# EasyEDA Pro project ProPrj_NavBot-EN01_2026-09-24.epro, board MAIN
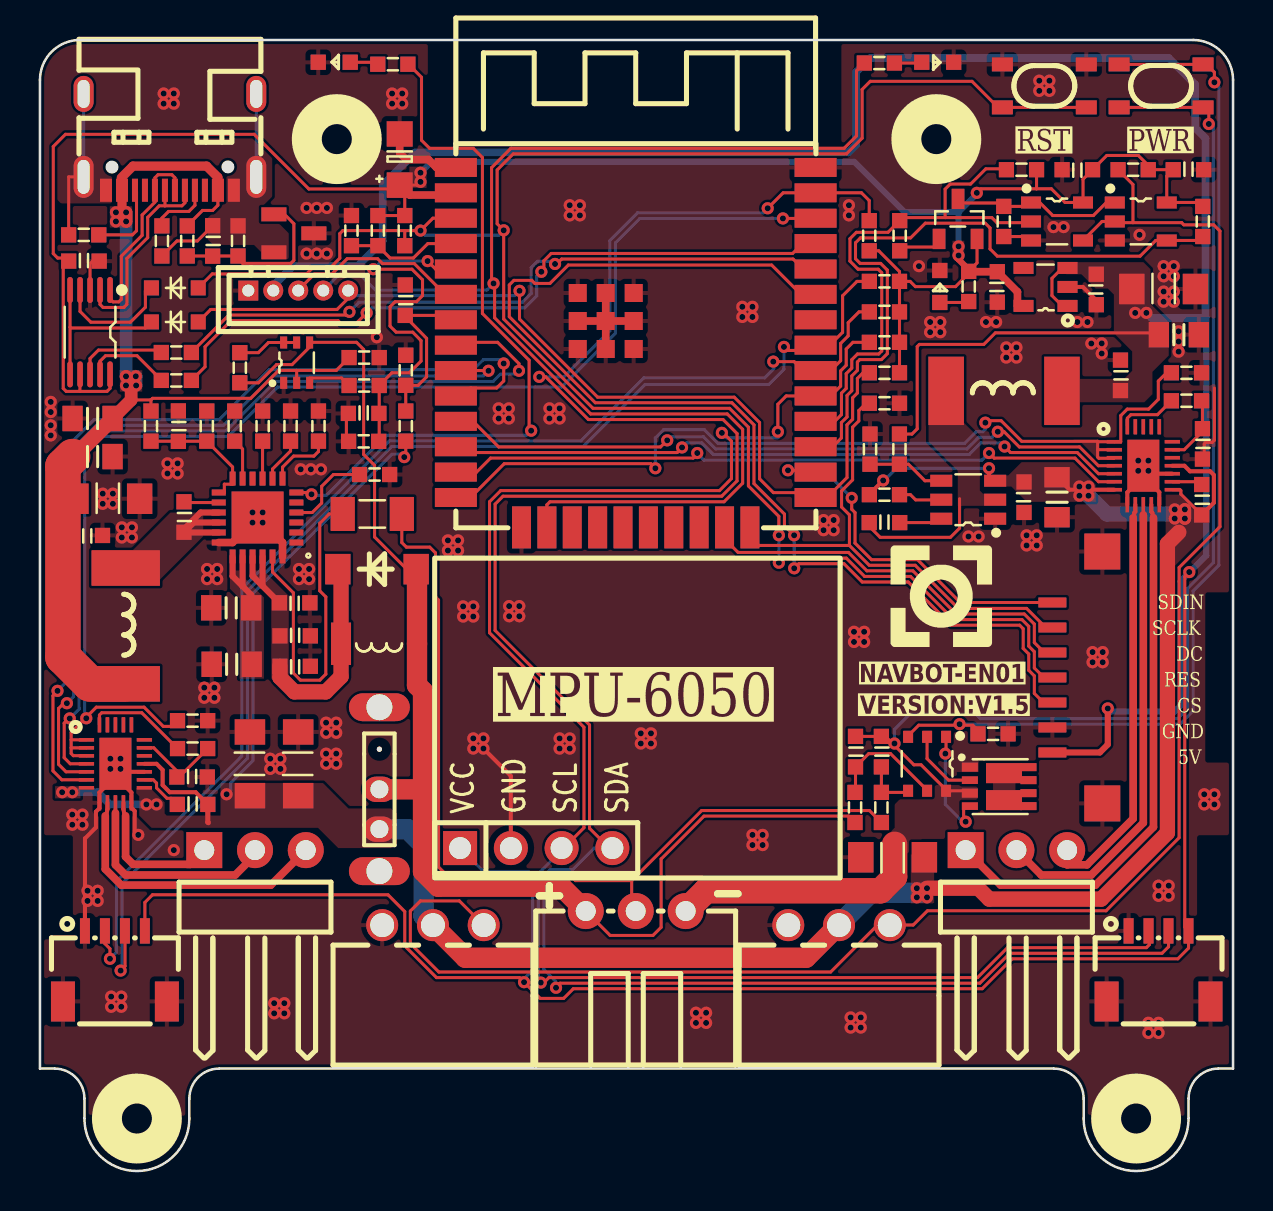
[diagram p9: board, top side]
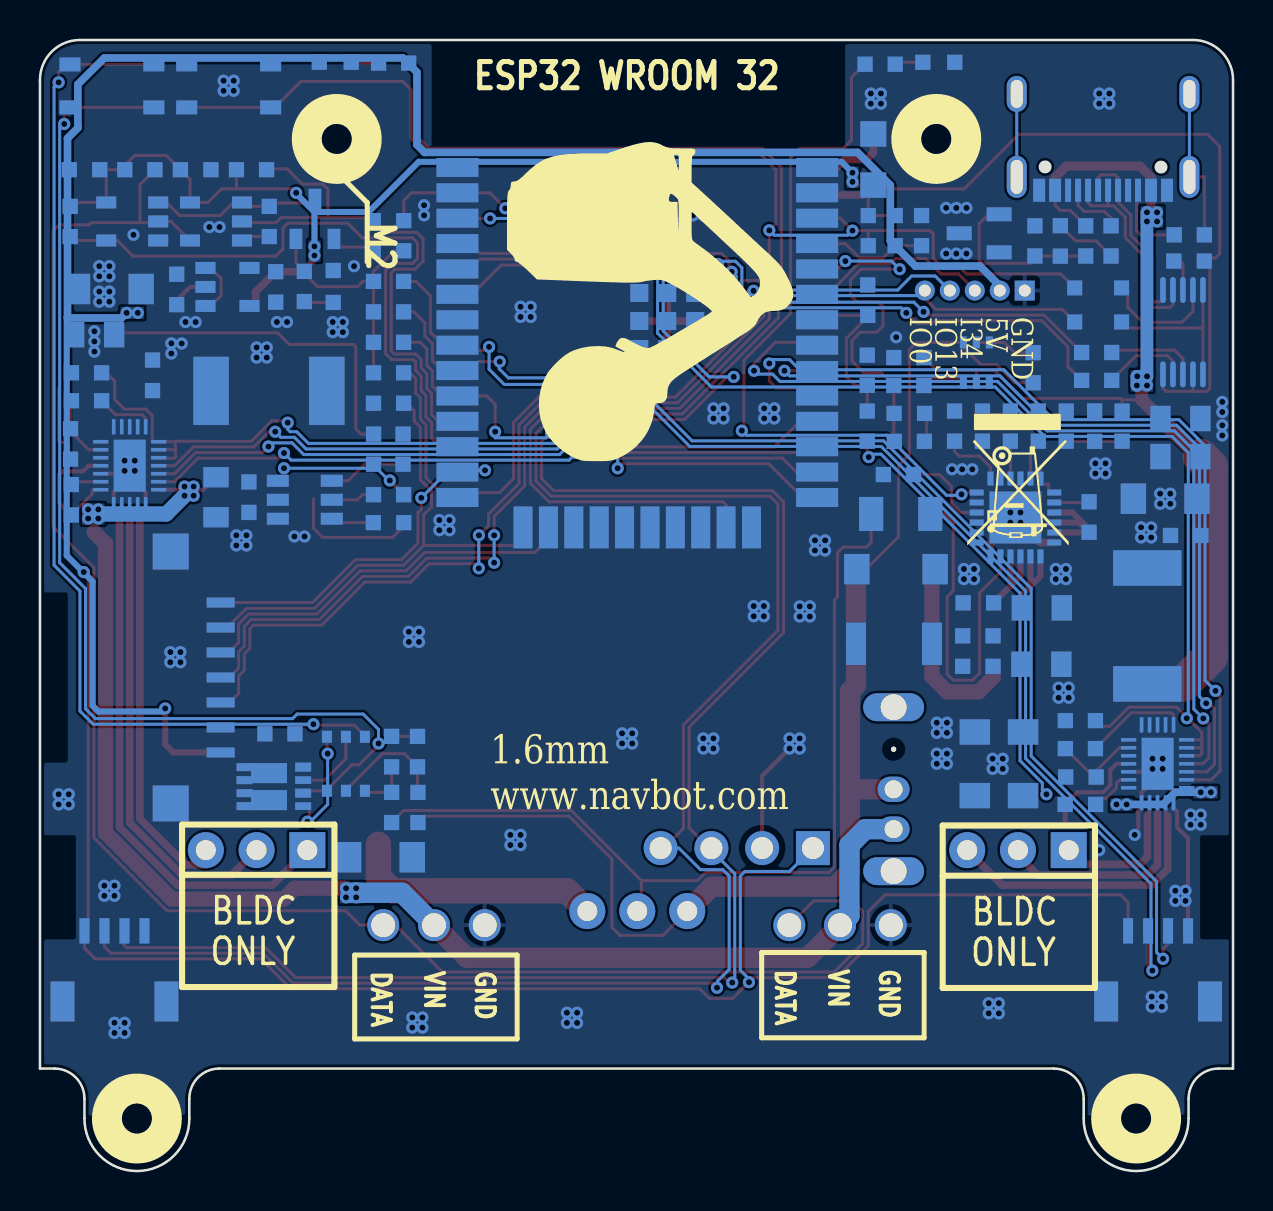
[diagram p10: board, bottom side, seen from below]

Outline 59.7 x 56.57 mm; copper layers: Top Layer, Bottom Layer. Coordinates in mm from the lower left corner of the outline.
Outline path: 0,54.57 0,5.12 0.72,5.12 arc(1.79,4.69) 2.22,3.62 2.22,2.62 arc(4.85,0) 7.47,2.62 7.47,3.62 arc(7.91,4.69) 8.97,5.12 50.72,5.12 arc(51.79,4.69) 52.22,3.62 52.22,2.62 arc(54.85,0) 57.47,2.62 57.47,3.62 arc(57.91,4.69) 58.97,5.12 59.7,5.12 59.7,54.57 arc(59.11,55.99) 57.7,56.57 2,56.57 arc(0.59,55.99) 0,54.57
Stack: Top Layer 0.035mm / Dielectric1 1.51mm FR4 er 4.5 / Bottom Layer 0.035mm

## Design rules (mm)
spacing Default (default): track to track 0.127, other pairs 0 to 0.152
spacing Plane_Default: track to track 0.127, other pairs 0 to 0.152
spacing Copper_gge147748: track to track 0.127, other pairs 0 to 0.152
spacing Copper_gge147355: track to track 0.127, other pairs 0 to 0.152
track width Default (default): min 0.127, default 0.152, max 25.4
differential pair differentialPair (default): width min 0.127, default 0.254, max 2.54; gap min 0.152, default 0.152
net GND uses Plane_Default, 十字焊盘_Default
net D- uses Copper_gge147748, Plane_Default
net D+ uses Copper_gge147748, Plane_Default
net VCC-3.3V uses Copper_gge147748, Plane_Default
net VCC-5V uses Copper_gge147748, Plane_Default
net RTS uses Copper_gge147748, Plane_Default
net DTR uses Copper_gge147748, Plane_Default
net BAT_ADC uses Copper_gge147748, Plane_Default
net VIN uses Copper_gge147748, Plane_Default
net DATA uses Copper_gge147748, Plane_Default
net TXD0 uses Copper_gge147748, Plane_Default
net TXEN uses Copper_gge147748, Plane_Default
net SERVO_RX uses Copper_gge147748, Plane_Default
net SCL_0 uses Copper_gge147748, Plane_Default
net SDA_0 uses Copper_gge147748, Plane_Default
net M0_OUT2 uses Copper_gge147748, Plane_Default
net M0_OUT1 uses Copper_gge147748, Plane_Default
net M0_OUT3 uses Copper_gge147748, Plane_Default
net M0_EN uses Copper_gge147748, Plane_Default
net M0_IN2 uses Copper_gge147748, Plane_Default
net M0_IN1 uses Copper_gge147748, Plane_Default
net M0_IN3 uses Copper_gge147748, Plane_Default
net EN uses Copper_gge147748, Plane_Default
net M1_IN1 uses Copper_gge147748, Plane_Default
net M1_IN2 uses Copper_gge147748, Plane_Default
net M1_IN3 uses Copper_gge147748, Plane_Default
net M1_EN uses Copper_gge147748, Plane_Default
net IO15 uses Copper_gge147748, Plane_Default
net SERVO_TX uses Copper_gge147748, Plane_Default
net SCL_1 uses Copper_gge147748, Plane_Default
net RXD0 uses Copper_gge147748, Plane_Default
net SDA_1 uses Copper_gge147748, Plane_Default
net M1_OUT2 uses Copper_gge147748, Plane_Default
net M1_OUT1 uses Copper_gge147748, Plane_Default
net M1_OUT3 uses Copper_gge147748, Plane_Default
net VBUS uses Copper_gge147748, Plane_Default
net $1N6461 uses Copper_gge147748, Plane_Default
net $1N6507 uses Copper_gge147748, Plane_Default
net $1N6486 uses Copper_gge147748, Plane_Default
net $1N17807 uses Copper_gge147748, Plane_Default
net $1N17803 uses Copper_gge147748, Plane_Default
net $1N16875 uses Copper_gge147748, Plane_Default
net $1N17094 uses Copper_gge147748, Plane_Default
net $1N17548 uses Copper_gge147748, Plane_Default
net $1N17578 uses Copper_gge147748, Plane_Default
net $1N18314 uses Copper_gge147748, Plane_Default
net $1N18226 uses Copper_gge147748, Plane_Default
net OLED_CS uses Copper_gge147748, Plane_Default
net OLED_SDI uses Copper_gge147748, Plane_Default
net VISION_ADC uses Copper_gge147748, Plane_Default
net $1N17219 uses Copper_gge147748, Plane_Default
net $1N17586 uses Copper_gge147748, Plane_Default
net $1N18959 uses Copper_gge147748, Plane_Default
net $1N21834 uses Copper_gge147748, Plane_Default
net $1N21795 uses Copper_gge147748, Plane_Default
net IN34 uses Copper_gge147748, Plane_Default
net OLED_SCLK uses Copper_gge147748, Plane_Default
net IO13 uses Copper_gge147748, Plane_Default
net BOOT0 uses Copper_gge147748, Plane_Default
net B1 uses Copper_gge147748, Plane_Default
net B2 uses Copper_gge147748, Plane_Default
net B- uses Copper_gge147748, Plane_Default
net $1N52202 uses Copper_gge147748, Plane_Default
net $1N52203 uses Copper_gge147748, Plane_Default
net $1N52206 uses Copper_gge147748, Plane_Default
net VSTA uses Copper_gge147748, Plane_Default
net $1N55084 uses Copper_gge147748, Plane_Default
net $1N55091 uses Copper_gge147748, Plane_Default
net CS uses Copper_gge147748, Plane_Default
net $1N62719 uses Copper_gge147748, Plane_Default
net $1N62774 uses Copper_gge147748, Plane_Default
pour e676 uses Copper_gge147748, 十字焊盘_Copper_gge147748
net $1N62802 uses 直连焊盘

## Placement (name value [footprint] x y rotation side)
C1  100nF  [C0603]  7.2 32.71 270 top
C2  10uF  [C0603]  6.95 37.26 270 top
C3  22uF  [C0805]  9.59 25.35 180 top
C4  22uF  [C0805]  9.57 28.17 180 top
C5  10uF  [C0603]  12.74 28.4 180 top
C6  10uF  [C0603]  12.77 25.22 180 top
C7  100nF  [C0603]  16.2 37.89 0 top
C8  1uF  [C0603]  8.64 46.52 270 top
C30  100nF  [C0603]  42.26 32.43 0 top
C32  22uF  [C0805]  56.99 41.83 180 top
C33  22uF  [C0805]  50.89 33.7 90 top
C34  100nF  [C0603]  49.24 33.7 90 top
C35  1uF  [C0603]  2.2 45.52 0 top
C36  100nF  [C0603]  18.28 43.56 270 top
C37  10uF  [C0603]  52.86 44.09 90 top
C38  10uF  [C0603]  47.9 44.22 90 top
C39  10uF  [CAP-SMD_L3.2-W1.6-RD-C7171]  18 50.59 90 top
C40  100nF  [C0603]  54.07 39.8 270 top
C41  4.7uF  [C0603]  7.61 19.71 0 top
C42  4.7uF  [C0603]  58.17 36.37 270 top
C43  1uF  [C0603]  7.64 18.34 0 top
C44  1uF  [C0603]  58.13 33.58 270 top
C46  100nF  [C0603]  57.47 50.09 0 top
C47  100nF  [C0603]  51.91 50.09 180 top
C48  100uF  [C1206]  12.92 20.37 270 top
C49  100uF  [C1206]  42.66 15.7 0 top
C50  100nF  [C0603]  40.81 20.98 270 top
C51  100nF  [C0603]  42.1 20.98 270 top
C53  100uF  [C1206]  3.39 33.63 180 top
C54  100nF  [C0603]  2.37 31.79 180 top
C55  100uF  [C1206]  10.51 20.37 270 top
C56  22uF  [C0805]  2.63 37.64 180 top
C57  22uF  [C0805]  2.63 35.74 0 top
C58  100uF  [C1206]  56.23 44.12 180 top
C59  10uF  [C0603]  12.77 26.8 0 top
CN2  HX25003-3WAP  [CONN-TH_3P-P2.50_HX25003-3WAP]  29.81 13 0 top
CN3  5264-3AW  [CONN-TH_5264-3AW]  19.66 11.6 0 top
CN4  5264-3AW  [CONN-TH_5264-3AW]  39.98 11.6 0 top
CN7  SS-12D02-VG4  [SW-TH_SS-12D02-VG4]  16.98 19.1 90 top
CN8  1.25-7P WT  [CONN-SMD_7P-P1.25-L4.4-W13.5]  51.86 24.69 90 top
CN10  HC-1.25-5A  [CONN-TH_5P-P1.25_HCTL_HC-1.25-5A]  12.92 44.04 0 top
CN11  WAFER-SH1.0-4PWB  [CONN-SMD_4P-P1.00_WAFER-SH1.0-4PWB]  3.75 10.31 0 top
CN12  WAFER-SH1.0-4PWB  [CONN-SMD_4P-P1.00_WAFER-SH1.0-4PWB]  55.97 10.31 0 top
D4  1N5819WS  [SOD-323_L1.8-W1.3-LS2.5-RD]  6.75 42.47 0 top
D5  1N5819WS  [SOD-323_L1.8-W1.3-LS2.5-RD]  6.75 44.17 0 top
D6  SS34F  [SMAF_L3.5-W2.6-LS4.7-RD-1]  16.86 30.11 0 top
H13  PZ254R-11-03P  [HDR-TH_3P-P2.54-H-M-W10.4]  10.76 16.05 0 top
H14  PZ254R-11-03P  [HDR-TH_3P-P2.54-H-M-W10.4]  48.86 16.05 0 top
H15  -  [HDR-TH_4P-P2.54-V-M]  24.83 16.15 0 top
L1  2.2uH  [IND-SMD_L7.0-W6.6]  48.24 39.03 0 top
L2  2.2uH  [IND-SMD_L4.4-W4.2]  16.97 26.37 180 top
L3  2.2uH  [IND-SMD_L7.0-W6.6]  4.3 27.27 270 top
LED1  KT-0603R  [LED0603-RD]  45.03 44.24 270 top
LED2  NCD0603B1  [LED0603-RD]  44.92 55.46 180 top
LED3  KT-0603R  [LED0603-RD]  14.72 55.46 0 top
Q1  SS8550-C148468  [SOT-23-3_L2.9-W1.3-P1.90-LS2.4-BR]  45.94 47.62 270 top
Q2  AO3400A  [SOT-23-3_L2.9-W1.3-P1.90-LS2.4-BR#2]  12.7 46.9 180 top
Q4  WSD3056DN33  [POWERPAK-SO-8_L3.0-W3.0-P0.65-BL]  48 19.23 270 top
Q5  CJ3439KDW  [SOT-363_L2.1-W1.3-P0.65-LS2.3-BL]  12.84 40.43 0 top
R1  51kΩ  [R0603]  16.74 34.84 180 top
R2  5.1kΩ  [R0603]  17.66 55.36 180 top
R3  1kΩ  [R0603]  13.94 37.26 270 top
R4  NC  [R0603]  12.54 37.26 270 top
R5  120kΩ  [R0603]  11.14 37.26 270 top
R6  75kΩ  [R0603]  9.75 37.26 270 top
R7  1Ω  [R0603]  5.55 37.26 90 top
R8  5.1kΩ  [R0603]  8.35 37.26 270 top
R9  100Ω  [R1206]  16.63 32.87 0 top
R10  1kΩ  [R0603]  16.2 36.5 0 top
R11  10kΩ  [R0603]  9.91 46.52 90 top
R12  10kΩ  [R0603]  16.22 40.69 0 top
R13  3kΩ  [R0603]  16.22 39.29 180 top
R14  10kΩ  [R0603]  10 40.18 270 top
R15  10kΩ  [R0603]  7.37 46.52 270 top
R26  4.7K  [R0603]  42.26 38.4 0 top
R27  4.7K  [R0603]  42.26 39.93 0 top
R30  4.7kΩ  [R0603]  7.64 21.13 180 top
R31  4.7kΩ  [R0603]  57.37 38.53 180 top
R32  10kΩ  [R0603]  42.26 33.83 0 top
R33  18kΩ  [R0603]  41.53 36.11 270 top
R34  100kΩ  [R0603]  43.01 36.11 90 top
R35  3kΩ  [R0603]  18.3 37.26 270 top
R36  1kΩ  [R0603]  18.3 40.05 270 top
R37  3.3kΩ  [R0603]  46.47 44.24 270 top
R38  4.7kΩ  [R0603]  7.64 22.53 0 top
R39  4.7kΩ  [R0603]  57.37 39.93 0 top
R40  4.7kΩ  [R0603]  42.26 41.45 0 top
R41  4.7kΩ  [R0603]  42.26 42.97 0 top
R42  4.7kΩ  [R0603]  42.26 44.5 0 top
R43  4.7kΩ  [R0603]  41.5 46.78 270 top
R46  10kΩ  [R0603]  54.7 50.09 0 top
R47  10kΩ  [R0603]  43.02 46.78 270 top
R48  10kΩ  [R0603]  49.12 50.09 0 top
R49  10kΩ  [R0603]  58.19 47.5 90 top
R50  10kΩ  [R0603]  48.23 47.5 90 top
R53  3.3kΩ  [R0603]  42 55.42 0 top
R54  10kΩ  [R0603]  18.25 47.04 270 top
R56  30kΩ  [R0603]  16.91 47.04 90 top
R57  2kΩ  [R0603]  15.59 47.04 270 top
R58  1kΩ  [R0603]  6.82 39.55 0 top
R59  1kΩ  [R0603]  6.82 40.94 0 top
R60  330Ω  [R0603]  40.78 18.18 90 top
R61  330Ω  [R0603]  42.1 18.18 90 top
R62  2kΩ  [R0603]  47.69 21.87 180 top
R63  4.7kΩ  [R0603]  6.1 46.52 270 top
R64  4.7kΩ  [R0603]  2.19 46.83 180 top
SW1  SKRPACE010  [KEY-SMD_4P-L4.2-W3.2-P2.20-LS4.6]  50.26 54.28 180 top
SW2  SKRPACE010  [KEY-SMD_4P-L4.2-W3.2-P2.20-LS4.6]  56.1 54.28 0 top
U1  IP2326  [VQFN-24_L4.0-W4.0-P0.50-BL-EP2.5]  10.89 32.69 90 top
U3  SN74LVC1G125DBVR  [SOT-23-5_L3.0-W1.7-P0.95-LS2.8-BR]  55.08 47.5 180 top
U5  ESP32-WROOM-32E-N8  [WIFI-SMD_ESP32-WROOM-32E]  29.81 41.2 270 top
U8  HY2120-LB  [SOT-23-6_L2.9-W1.6-P0.95-LS2.8-BR]  44.39 20.37 90 top
U10  SN74LVC1G126DBVR  [SOT-23-5_L3.0-W1.7-P0.95-LS2.8-BR]  50.89 47.5 180 top
U12  XC6210B332MR  [SOT-23-5_L2.9-W1.6-P0.95-LS2.8-BR]  50.32 44.22 0 top
U13  SS6343M  [QFN-24_L4.0-W3.0-P0.40-TL-EP]  3.78 20.37 0 top
U14  SS6343M  [QFN-24_L4.0-W3.0-P0.40-TL-EP]  55.21 35.28 0 top
U15  CH340X  [MSOP-10_L3.0-W3.0-P0.50-LS5.0-BL]  2.51 41.96 180 top
U16  TPS563201DDCR  [SOT-23-6_L2.9-W1.6-P0.95-LS2.8-BR#2]  46.45 33.58 0 top
USB1  TYPEC-304-ACP16  [USB-C-SMD_TYPE-C-16P-1]  6.5 51.47 180 top

## Footprints (pads in the part's own frame, mm; a bottom-side part is the same pattern mirrored in y, then rotated)
C0603
  rect 0.762x0.762 hole 0.001: 1(-0.762,-0.025) 2(0.762,-0.025)
C0805
  rect 1.016x1.27 hole 0.001: 1(-1,0) 2(1,0)
C1206
  rect 1.27x1.524 hole 0.001: 1(-1.593,0) 2(1.593,0)
CAP-SMD_L3.2-W1.6-RD-C7171
  rect 1.27x1.296 hole 0.001: 1(-1.28,0) 2(1.28,0)
CONN-SMD_4P-P1.00_WAFER-SH1.0-4PWB
  rect 0.5x1.27 hole 0.001: 1(-1.5,1.7) 2(-0.5,1.7) 3(0.5,1.7) 4(1.5,1.7)
  rect 1.2x2 hole 0.001: 5(-2.6,-1.83) 6(2.6,-1.83)
CONN-SMD_7P-P1.25-L4.4-W13.5
  rect 1.8x1.8 hole 0.001: 0(-6.3,-1.3) 0(6.3,-1.3)
  rect 0.5x1.4 hole 0.001: 1(-3.75,1.198) 2(-2.5,1.198) 3(-1.25,1.198) 4(0,1.198) 5(1.25,1.198) 6(2.499,1.198) 7(3.75,1.198)
CONN-TH_3P-P2.50_HX25003-3WAP
  round 1.8 hole 1: 1(-2.5,0) 2(0.001,0) 3(2.5,0)
CONN-TH_5P-P1.25_HCTL_HC-1.25-5A
  rect 1x1 hole 0.6: 1(-2.5,0)
  round 1 hole 0.6: 2(-1.25,0) 3(0,0) 4(1.25,0) 5(2.5,0)
CONN-TH_5264-3AW
  round 1.6 hole 1.2: 1(2.54,0.7) 2(0,0.7) 3(-2.54,0.7)
HDR-TH_3P-P2.54-H-M-W10.4
  rect 1.8x1.8 hole 1: 1(-2.54,0)
  round 1.8 hole 1: 2(0,0) 3(2.54,0)
HDR-TH_4P-P2.54-V-M
  rect 1.7x1.7 hole 1.1: 1(-3.81,0)
  round 1.7 hole 1.1: 2(-1.27,0) 3(1.27,0) 4(3.81,0)
IND-SMD_L4.4-W4.2
  rect 1x2.12 hole 0.001: 1(1.901,0) 2(-1.901,0)
IND-SMD_L7.0-W6.6
  rect 1.778x3.42 hole 0.001: 1(-2.893,-0.006) 2(2.901,-0.006)
KEY-SMD_4P-L4.2-W3.2-P2.20-LS4.6
  rect 1.05x0.7 hole 0.001: 1(-2.1,1.075) 2(2.1,1.075) 3(-2.1,-1.075) 4(2.1,-1.075)
LED0603-RD
  rect 0.762x0.762 hole 0.001: 1(-0.799,0) 2(0.799,0)
MSOP-10_L3.0-W3.0-P0.50-LS5.0-BL
  oval 0.28x1.3 hole 0.001: 1(-1,-2.11) 2(-0.5,-2.11) 3(0,-2.11) 4(0.5,-2.11) 5(1,-2.11) 6(1,2.11) 7(0.5,2.11) 8(0,2.11) 9(-0.5,2.11) 10(-1,2.11)
POWERPAK-SO-8_L3.0-W3.0-P0.65-BL
  rect 0.457x0.8 hole 0.001: 1(-0.975,-1.466) 3(0.325,-1.466)
  rect 0.381x0.8 hole 0.001: 2(-0.325,-1.466) 4(0.975,-1.466)
  rect 0.4x0.8 hole 0.001: 5(0.975,1.466) 6(0.325,1.466) 7(-0.325,1.466) 8(-0.975,1.466)
  rect 1x1.8 hole 0.001: 9(-0.675,0.241) 10(0.675,0.241)
QFN-24_L4.0-W3.0-P0.40-TL-EP
  rect 0.762x0.178 hole 0.001: 1(-1.45,1.2) 2(-1.45,0.8) 3(-1.45,0.4) 4(-1.45,0) 5(-1.45,-0.4) 6(-1.45,-0.8) 7(-1.45,-1.2) 13(1.45,-1.2) 14(1.45,-0.8) 15(1.45,-0.4) 16(1.45,-0.001) 17(1.45,0.4) 18(1.45,0.8) 19(1.45,1.2)
  rect 0.178x0.762 hole 0.001: 8(-0.8,-1.95) 9(-0.4,-1.95) 10(0,-1.95) 11(0.4,-1.95) 12(0.8,-1.95) 20(0.8,1.95) 21(0.4,1.95) 22(0,1.95) 23(-0.4,1.95) 24(-0.8,1.95)
  rect 1.6x2.6 hole 0.001: 25(0,0)
R0603
  rect 0.762x0.762 hole 0.001: 1(-0.753,0) 2(0.753,0)
R1206
  rect 1.208x1.701 hole 0.001: 1(-1.479,0) 2(1.479,0)
SMAF_L3.5-W2.6-LS4.7-RD-1
  rect 1.27x1.524 hole 0.001: 1(-1.96,0) 2(1.96,0)
SOD-323_L1.8-W1.3-LS2.5-RD
  rect 0.75x0.75 hole 0.001: 1(-1.173,0) 2(1.173,0)
SOT-23-3_L2.9-W1.3-P1.90-LS2.4-BR
  rect 1.016x0.635 hole 0.001: 1(1,-0.95) 2(1,0.95) 3(-1,0)
SOT-23-3_L2.9-W1.3-P1.90-LS2.4-BR#2
  rect 1.25x0.7 hole 0.001: 1(1,-0.95) 2(1,0.95) 3(-1,0)
SOT-23-5_L2.9-W1.6-P0.95-LS2.8-BR
  rect 1x0.6 hole 0.001: 1(1.1,-0.95) 2(1.1,0) 3(1.1,0.95) 4(-1.1,0.95) 5(-1.1,-0.95)
SOT-23-5_L3.0-W1.7-P0.95-LS2.8-BR
  rect 1x0.6 hole 0.001: 1(1.3,-0.95) 2(1.3,0) 3(1.3,0.95) 4(-1.3,0.95) 5(-1.3,-0.95)
SOT-23-6_L2.9-W1.6-P0.95-LS2.8-BR
  rect 0.6x0.5 hole 0.001: 1(1.35,-0.95) 2(1.35,0) 3(1.35,0.95) 4(-1.35,0.95) 5(-1.35,0) 6(-1.35,-0.95)
SOT-23-6_L2.9-W1.6-P0.95-LS2.8-BR#2
  rect 1.1x0.6 hole 0.001: 1(1.35,-0.95) 2(1.35,0) 3(1.35,0.95) 4(-1.35,0.95) 5(-1.35,0) 6(-1.35,-0.95)
SOT-363_L2.1-W1.3-P0.65-LS2.3-BL
  rect 0.35x0.6 hole 0.001: 1(-0.65,-1.01) 2(0,-1.01) 3(0.65,-1.01) 4(0.65,1.01) 5(0,1.01) 6(-0.65,1.01)
SW-TH_SS-12D02-VG4
  oval 1.27x1.6 hole 0.9: 1(-2,0) 2(-0.006,0)
  oval 0.254x0.254 hole 0.9: 3(2,0)
  oval 1.397x3.048 hole 1.3: 4(4.1,0) 5(-4.1,0)
USB-C-SMD_TYPE-C-16P-1
  rect 0.6x1.15 hole 0.001: A1B12(-3.2,2.41) A4B9(-2.4,2.41) B1A12(3.2,2.41) B4A9(2.4,2.41)
  rect 0.3x1.15 hole 0.001: A5(-1.25,2.41) A6(-0.25,2.41) A7(0.25,2.41) A8(1.25,2.41) B5(1.75,2.41) B6(0.75,2.41) B7(-0.75,2.41) B8(-1.75,2.41)
  oval 1x2.1 hole 0.6x1.7: EP(-4.32,1.74) EP(4.32,1.74)
  oval 1x1.8 hole 0.6x1.4: EP(-4.32,-2.41) EP(4.32,-2.41)
VQFN-24_L4.0-W4.0-P0.50-BL-EP2.5
  rect 0.3x0.7 hole 0.001: 1(-1.25,-1.942) 2(-0.75,-1.942) 3(-0.25,-1.942) 4(0.25,-1.942) 5(0.75,-1.942) 6(1.25,-1.942) 13(1.25,1.942) 14(0.75,1.942) 15(0.25,1.942) 16(-0.25,1.942) 17(-0.75,1.942) 18(-1.25,1.942)
  rect 0.7x0.3 hole 0.001: 7(1.948,-1.25) 8(1.948,-0.75) 9(1.948,-0.25) 10(1.948,0.25) 11(1.948,0.75) 12(1.948,1.25) 19(-1.948,1.25) 20(-1.948,0.75) 21(-1.948,0.25) 22(-1.948,-0.25) 23(-1.948,-0.75) 24(-1.948,-1.25)
  rect 2.6x2.6 hole 0.001: 25(0.001,-0.001)
WIFI-SMD_ESP32-WROOM-32E
  rect 0.95x2.1 hole 0.001: 1(-9.002,-9) 2(-7.732,-9) 3(-6.463,-9) 4(-5.192,-9) 5(-3.922,-9) 6(-2.652,-9) 7(-1.383,-9) 8(-0.113,-9) 9(1.157,-9) 10(2.428,-9) 11(3.697,-9) 12(4.968,-9) 13(6.237,-9) 14(7.508,-9) 25(7.508,9) 26(6.237,9) 27(4.968,9) 28(3.697,9) 29(2.428,9) 30(1.157,9) 31(-0.113,9) 32(-1.383,9) 33(-2.652,9) 34(-3.922,9) 35(-5.192,9) 36(-6.463,9) 37(-7.732,9) 38(-9.002,9)
  rect 2.1x0.95 hole 0.001: 15(9.002,-5.715) 16(9.002,-4.445) 17(9.002,-3.175) 18(9.002,-1.905) 19(9.002,-0.635) 20(9.002,0.635) 21(9.002,1.905) 22(9.002,3.175) 23(9.002,4.445) 24(9.002,5.715)
  rect 0.9x0.9 hole 0.001: 39(-2.721,-0.1) 39(-2.721,-1.5) 39(-2.721,-2.9) 39(-1.321,-0.1) 39(-1.321,-1.5) 39(-1.321,-2.9) 39(0.079,-0.1) 39(0.079,-1.5) 39(0.079,-2.9)

## Nets
As in the schematic.

Pads without a net: CN7 3 4 5; U1 1 2 3 5 10; U5 17 18 19 20 21 22 32; U12 4; U13 17 19 20 21 22 23; U14 17 19 20 21 22 23; USB1 A8 B8

## Via types
v1: diameter 0.61, hole 0.305, Top Layer to Bottom Layer, 294 vias

## Routing (per net, layer and track width the routed paths; a pad name or vN(x,y) marks a point on that pad's centre or on a via; arc(x,y) is an arc through that point)
GND: length 50.2
  Top Layer w0.152: U10.3 49.4,46.74 R50.1 ; 15.34,36.5 15.33,36.51 15.33,37.89 ; 58.77,39.16 58.77,36.55 58.66,36.45 58.33,36.45 58.26,36.37 58.26,35.7 C42.2 ; 3.14,45.52 2.63,45.52 2.51,45.39 U15.3
  Top Layer w0.203: v1(4.92,16.81) 4.74,16.99 4.74,18.01 4.58,18.17 U13.12 4.58,18.93 3.78,19.73 2.98,18.93 U13.8 2.98,18.15 2.8,17.97 2.8,17.19 2.25,16.64 CN11.1 ; U14.8 54.41,33.95 55.06,34.59 55.21,34.59 ; U13.25 4.18,19.97 U13.15 ; U14.12 56.01,33.95 55.41,34.55 55.21,34.55 55.19,34.57 55.21,34.59 ; C37.1 52.86,43.55 52.19,44.22 U12.2 ; 55.5,34.88 55.21,34.88 ; 55.5,34.88 U14.15 ; 55.5,34.88 55.21,34.59 ; 55.21,34.88 U14.25 ; 55.21,34.88 55.21,34.59 ; v1(22.19,21.13) 23.56,19.76 H15.2
  Top Layer w0.381: U5.1 19.84,50.2 19.44,50.59 18.33,50.59 18,50.92 C39.2 ; U5.39 U5.39 ; U5.39 U5.39 ; U5.39 U5.39 ; U5.39 U5.39 ; U1.24 12.14,31.44 v1(11.14,32.43) U1.25 v1(10.63,32.43) 9.64,31.44 U1.18
  vias: v1(0.54,38.47) v1(0.54,37.96) v1(0.54,37.3) v1(0.54,36.79) v1(1.62,17.83) v1(1.62,17.32) v1(2.12,17.83) v1(2.12,17.32) v1(2.38,14.02) v1(2.38,13.51) v1(2.89,14.02) v1(2.89,13.51) v1(3.14,33.88) v1(3.14,33.37) v1(3.52,20.62) v1(3.52,20.11) v1(3.56,8.72) v1(3.56,8.22) v1(3.65,33.88) v1(3.65,33.37) v1(4.09,32.2) v1(4.09,31.69) v1(4.03,20.62) v1(4.03,20.11) v1(4.07,8.72) v1(4.07,8.22) v1(4.6,32.2) v1(4.6,31.69) v1(6.19,53.9) v1(6.19,53.39) v1(6.38,35.4) v1(6.38,34.89) v1(6.7,53.9) v1(6.7,53.39) v1(6.7,16.05) v1(6.89,35.4) v1(6.89,34.89) v1(8.22,24.18) v1(8.22,23.67) v1(8.36,30.11) v1(8.36,29.61) v1(8.73,24.18) v1(8.73,23.67) v1(8.87,30.11) v1(8.87,29.61) v1(10.63,32.94) v1(11.14,32.94) v1(11.52,20.62) v1(11.52,20.11) v1(11.72,8.39) v1(11.72,7.89) v1(12.03,20.62) v1(12.03,20.11) v1(12.23,8.39) v1(12.23,7.89) v1(12.96,30.11) v1(12.96,29.61) v1(13.05,35.1) v1(13.34,48.17) v1(13.34,45.89) v1(13.47,30.11) v1(13.47,29.61) v1(13.56,35.1) v1(13.85,48.17) v1(13.85,45.89) v1(14.06,35.1) v1(14.32,22.43) v1(14.32,21.92) v1(14.32,20.88) v1(14.32,20.37) v1(14.36,48.17) v1(14.36,45.89) v1(14.82,22.43) v1(14.82,21.92) v1(14.82,20.88) v1(14.82,20.37) v1(16.86,41.7) v1(17.62,53.9) v1(17.62,53.39) v1(18.13,53.9) v1(18.13,53.39) v1(20.41,31.55) v1(20.41,31.04) v1(20.92,31.55) v1(20.92,31.04) v1(21.17,28.24) v1(21.17,27.73) v1(21.68,28.24) v1(21.68,27.73) v1(21.68,21.64) v1(21.68,21.13) v1(22.19,21.64) v1(22.95,38.15) v1(22.95,37.64) v1(23.46,38.15) v1(23.46,37.64) v1(23.48,28.26) v1(23.48,27.75) v1(23.98,28.26) v1(23.98,27.75) v1(25.49,38.15) v1(25.49,37.64) v1(26,38.15) v1(26,37.64) v1(26,21.64) v1(26,21.13) v1(26.51,48.31) v1(26.51,47.8) v1(26.51,21.64) v1(26.51,21.13) v1(27.02,48.31) v1(27.02,47.8) v1(30.06,21.89) v1(30.06,21.38) v1(30.57,21.89) v1(30.57,21.38) v1(32.82,7.92) v1(32.82,7.41) v1(33.33,7.92) v1(33.33,7.41) v1(35.15,43.23) v1(35.15,42.72) v1(35.65,43.23) v1(35.65,42.72) v1(35.65,16.81) v1(35.65,16.3) v1(36.16,16.81) v1(36.16,16.3) v1(39.21,32.56) v1(39.21,32.05) v1(39.72,32.56) v1(39.72,32.05) v1(40.48,48.31) v1(40.48,47.8) v1(40.56,7.68) v1(40.56,7.17) v1(40.73,26.97) v1(40.73,26.46) v1(41.07,7.68) v1(41.07,7.17) v1(41.24,26.97) v1(41.24,26.46) v1(43.98,45.26) v1(44.54,42.47) v1(44.54,41.96) v1(45.05,42.47) v1(45.05,41.96) v1(46.46,31.74) v1(46.97,31.74) v1(47.34,42.47) v1(47.84,42.47) v1(48.35,41.2) v1(48.35,40.69) v1(48.86,41.2) v1(48.86,40.69) v1(49.37,31.8) v1(49.37,31.29) v1(49.88,31.8) v1(49.88,31.29) v1(50,54.54) v1(50,54.03) v1(50.51,54.54) v1(50.51,54.03) v1(50.72,47.22) v1(51.22,47.22) v1(51.91,42.47) v1(52.42,42.47) v1(52.61,41.39) v1(52.67,25.96) v1(52.67,25.45) v1(53.13,41.4) v1(53.13,40.89) v1(53.18,25.96) v1(53.18,25.45) v1(55.02,46.83) v1(54.96,35.53) v1(54.96,35.02) v1(55.47,35.53) v1(55.47,35.02) v1(55.47,7.41) v1(55.47,6.91) v1(55.97,14.27) v1(55.97,13.77) v1(55.97,7.41) v1(55.97,6.91) v1(56.23,45.26) v1(56.23,44.75) v1(56.23,43.99) v1(56.23,43.48) v1(56.48,14.27) v1(56.48,13.77) v1(56.73,45.26) v1(56.73,44.75) v1(56.73,43.99) v1(56.73,43.48) v1(56.98,42) v1(56.98,41.49) v1(56.98,40.99) v1(58.26,18.84) v1(58.26,18.34) v1(58.77,18.84) v1(58.77,18.34)
VBUS: length 52.5
  Top Layer w0.152: Q5.2 12.84,40.04 12.85,40.05 ; R12.1 14.83,40.05 12.85,40.05 ; USB1.A4B9 8.9,48.31 8.64,48.05 8.13,48.05 7.37,47.28 7.37,47.28 ; R7.2 5.55,38.57 ; 5.55,38.57 4.56,38.57 ; 5.55,38.57 5.63,38.65 10.55,38.65 11.94,40.05 12.85,40.05
  Top Layer w0.457: USB1.A4B9 8.9,49.7 8.34,50.27 4.65,50.27 4.07,49.68 ; 4.1,49.68 USB1.B4A9 4.1,47.74
  Top Layer w0.635: v1(4.31,47.95) v1(4.31,47.5) ; C56.1 4.56,38.57 4.56,39.49 v1(4.3,39.75)
  Top Layer w0.762: C56.1 1.73,35.74 C57.1
  Top Layer w1.778: C57.1 1.15,35.25 1.15,25.72 2.5,24.37 L3.2
  Bottom Layer w0.635: v1(4.81,39.29) 4.81,39.74 v1(4.8,39.75) 4.31,39.75 v1(4.31,47.5) v1(4.31,47.95)
  vias: v1(3.8,47.95) v1(3.8,47.5) v1(4.3,39.29)
VCC-3.3V: length 107.7
  Top Layer w0.152: R42.2 43.01,44.99 41.97,46.03 R43.2 ; R42.2 R41.2 R40.2 R27.2 ; R42.2 43.54,44.5 43.81,44.24 45.81,44.24 46.57,45 ; U15.10 3.51,39.15 3.35,39 2,39 ; 49.87,49.13 R48.2 ; 49.87,49.13 50.61,49.13 51.29,48.45 U10.5 52.19,49.61 C47.1 53.38,50.8 54.96,50.8 55.46,50.3 R46.2 C46.1 56.38,49.76 56.38,48.45 57.99,48.45 R49.2 ; 49.87,49.13 47.08,49.13 v1(46.88,48.93) ; 2,39 2,39.84 U15.7 ; 2,39 1.31,39 1.16,39.15 1.16,45.24 C35.1 1.29,45.67 0.89,45.67 0.67,45.89 0.67,51.25 1.27,51.86 10.72,51.86 13.45,49.12 17.81,49.12 C39.1 18.88,49.32 v1(19.04,49.48) ; 46.57,45.11 46.89,45.43 46.89,46.42 ; 18.25,49.06 R54.1 R56.2
  Top Layer w0.305: 46.57,45 46.57,45.11 46.45,45.11 45.97,45.6 v1(45.97,45.79)
  Top Layer w0.381: U5.2 20.7,48.82 18.5,48.82 18.25,49.06 ; 46.57,45 46.59,44.98 C38.2 48.91,43.98 48.91,43.27 U12.5
  Bottom Layer w0.305: 45.97,47.97 43.26,47.97 40.75,50.48 19.59,50.48 v1(19.04,49.93) ; 45.97,47.97 46.88,48.88 v1(46.88,48.93) ; 45.97,47.97 45.97,46.02
  vias: v1(45.97,46.25)
VCC-5V: length 206
  Top Layer w0.152: C32.2 55.9,41.93 47.81,41.93 47.23,41.35 44,41.35 43.9,41.24 43.9,37.12 43.63,36.86 R34.2 ; U12.3 51.16,45.17 50.64,44.65 50.64,43.79 51.18,43.25 51.39,43.25 U12.1 ; v1(57.51,29.96) 57.28,29.73 57.28,12.2 CN12.4 57.47,11.15 56.94,10.61 48.64,10.61 47.15,9.12 26.69,9.12 26.2,8.63 25.04,8.63 v1(24.22,9.45) 23.99,9.68 19.84,9.68 18.25,11.26 18.25,12.98 17.42,13.82 5.63,13.82 5.25,13.44 CN11.4
  Top Layer w0.305: CN8.1 53.04,20.94 53.43,21.33 v1(53.43,23.14)
  Bottom Layer w0.152: v1(24.22,9.45) 24.22,9.61 24.66,10.04 24.66,14.76 24.43,14.98 22.19,14.98 H15.1
  Bottom Layer w0.305: v1(53.43,23.14) 53.59,22.98 56.78,22.98 57.06,23.27 57.06,29.49 58.36,30.79 58.36,42.67 58.32,42.71
  Bottom Layer w0.381: 58.32,42.71 58.32,51.66 57.8,52.18 57.8,54.35 56.48,55.67 41.55,55.67 40.83,54.96 40.83,51.33 40.45,50.95 18.78,50.95 17.15,49.32 17.15,46.52 15.89,45.27 12.66,45.27 11.67,44.28 CN10.2 ; 58.32,42.71 58.32,42.67 ; 58.32,42.71 58.28,42.67 55.62,42.67 v1(55.36,42.92)
  vias: v1(54.8,42.92)
VIN: length 116.1
  Top Layer w0.152: C44.2 57.09,33.86 57.09,34.03 57.05,34.08 U14.13 ; v1(18.23,35.71) 18.3,35.79 R35.2
  Top Layer w0.203: U14.7 51.52,34.08 C33.2 ; C44.2 58.13,32.82 58.74,33.43 58.74,34.81 58.56,35 57.55,35 57.27,35.28 U14.16 ; v1(42.19,34.54) 41.5,33.85 R32.1 ; U16.3 47.49,34.53 v1(47.49,35.15) ; C43.2 7.79,18.95 6.49,18.95 6.14,19.3 6.14,20.06 5.83,20.37 U13.16
  Top Layer w0.254: 8.42,17.42 8.4,17.45 C43.2
  Top Layer w0.635: v1(57.29,33.09) v1(57.29,32.64)
  Top Layer w0.762: 56.99,31.95 56.42,31.38 56.42,16.92 53.1,13.6 47.5,13.6 46.96,14.15 v1(44.39,14.15)
  Top Layer w1.016: 19.65,12.31 21.29,10.67 38.33,10.67 39.97,12.31
  Bottom Layer w0.152: v1(47.49,35.15) 42.85,35.15 42.24,34.54 v1(42.19,34.54) ; v1(9.34,18.84) 9.54,19.05 9.54,19.41 10.66,20.52 10.66,28.9 17.61,35.86 18.08,35.86 v1(18.23,35.71)
  Bottom Layer w0.381: v1(1.62,18.95) 2.89,18.95 3.5,18.34 v1(5.33,18.34)
  Bottom Layer w0.762: v1(52.47,33.78) 53.38,32.87 57.04,32.87
  Bottom Layer w1.016: 44.14,13.92 41.58,13.92 39.97,12.31 ; CN7.1 18.4,17.1 19.19,16.3 19.19,12.76 19.65,12.31
  vias: v1(1.11,18.95) v1(5.83,18.34) v1(43.88,14.15) v1(43.88,13.69) v1(44.39,13.69) v1(52.01,34.24) v1(52.01,33.78) v1(52.47,34.24) v1(56.78,33.09) v1(56.78,32.64)
B1: length 44.9
  Top Layer w0.152: 29.61,14.53 26.79,14.53 26.39,14.93 20.22,14.93 19.94,15.21 19.94,28.56 19.79,28.71 19.79,30.92 19.5,31.21 18.34,31.21 18.11,31.43 R9.2 ; 29.61,14.53 29.61,13.21 CN2.2 ; 29.61,14.53 33.11,18.03 41.51,18.03 R61.1
B2: length 64.7
  Top Layer w0.152: D6.2 18.35,30.11 16.74,31.71 16.74,35.3 16.2,35.84 16.2,41.1 15.84,41.45 13.5,41.45 Q5.4 13.49,41.22 12.61,40.34 11.84,40.34 10.93,39.43 R14.2 ; R60.1 40.46,17.75 33.23,17.75 31.08,15.6 31.08,12.19 30.67,11.78 28.53,11.78 CN2.1
  Top Layer w1.016: 19.17,19.09 19.17,14.98 19.92,14.22 26.09,14.22 CN2.1 ; 19.17,19.09 CN7.2 ; 19.17,19.09 19.17,23.99 18.87,24.3 L2.2 18.87,30.06 D6.2
B-: length 70.8
  Top Layer w0.152: Q4.3 46.41,19.02 U8.6 45.34,19.07 44.09,20.32 43.73,20.32 42.31,21.74 C51.1 C50.1 ; v1(58.49,52.37) 58.49,52.92 SW2.4 SW2.3
  Top Layer w1.27: CN2.3 33.33,14.02 42.06,14.02 42.76,14.72 42.76,16.34
  Bottom Layer w0.152: v1(42.76,21.38) 42.76,22.09 43.53,22.86 46.83,22.86 47.06,22.63 56.92,22.63 57.42,23.13 57.42,29.14 58.72,30.43 58.72,52.27 58.61,52.37 v1(58.49,52.37)
BAT_ADC: length 8.6
  Top Layer w0.152: R35.1 R36.2 18.92,39.3 19.35,39.72 19.35,41.65 18.28,42.74 C36.2 20.59,42.8 U5.7
BOOT0: length 46.6
  Top Layer w0.152: R27.1 41.19,39.93 40.9,39.64 40.9,38.91 40.66,38.68 40.66,37.6 40.38,37.32 40.38,34.69 39.39,33.69 U5.25 38.57,33.93 36.7,33.93 36.01,34.62 36.01,37.44 34.74,38.71 27.91,38.71 24,42.62 v1(24,44.03) ; D4.2 8.54,43.09 14.86,43.09 15.42,43.65 CN10.5
  Bottom Layer w0.152: CN10.5 15.68,43.79 23.76,43.79 v1(24,44.03)
CS: length 53.5
  Top Layer w0.152: SW2.1 SW2.2 58.38,55.35 58.77,54.96 v1(58.77,54.46) ; R62.2 46.94,22.04 46.68,22.3 43.97,22.3 43.44,21.77 U8.3
  Bottom Layer w0.152: v1(46.02,22.35) 57.04,22.35 57.7,23.01 57.7,29.01 59,30.3 59,54.23 v1(58.77,54.46)
D+: length 9.7
  Top Layer w0.152: U15.1 3.51,43.63 3.66,43.47 3.94,43.47 4.07,43.6 4.07,45.76 5.11,46.8 5.11,47.82 5.75,48.46 USB1.B6 5.75,49.68 5.91,49.83 6.6,49.83 6.75,49.68 USB1.A6
D-: length 10.5
  Top Layer w0.152: U15.2 3.01,43.35 3.16,43.2 4.2,43.2 4.35,43.35 4.35,45.64 5.39,46.69 5.39,47.7 5.97,48.28 6.25,48.28 ; 6.25,48.28 7.1,48.28 7.25,48.43 USB1.B7 ; 6.25,48.28 USB1.A7
DATA: length 89.4
  Top Layer w0.152: 54.69,47.44 57.13,47.44 57.24,47.33 58.73,47.33 59.05,47.01 59.05,32.23 57,30.19 57,16.67 53.35,13.02 44.41,13.02 43.7,12.31 41.92,12.31 39.56,9.95 19.96,9.95 18.53,11.38 18.53,13 19.04,13.51 20.99,13.51 22.19,12.31 ; 54.69,47.44 53.84,47.44 U3.2 53.14,47.5 U10.4 ; 54.69,47.44 54.69,49.35 R46.1
DTR: length 8.4
  Top Layer w0.152: 5.58,42.47 5.27,42.17 1.54,42.17 1.51,42.21 ; 1.51,42.21 U15.6 ; 1.51,42.21 U15.5
EN: length 100.2
  Top Layer w0.152: SW1.1 SW1.2 47.94,53.2 46.64,54.51 41.55,54.51 41.14,54.1 41.14,51.66 40.36,50.88 23.68,50.88 22.88,50.07 22.88,47.38 v1(23.2,47.05) 23.2,42.62 27.67,38.15 34.51,38.15 35.45,37.21 35.45,34.27 36.97,32.74 v1(36.97,31.8) ; CN8.4 50.23,24.69 49.76,25.16 49.76,25.98 49.48,26.25 49.48,27.24 49.14,27.58 45.72,27.58 43.56,29.74 41.26,29.74 40.35,30.66 37.2,30.66 v1(36.97,30.43) ; 18.26,47.04 15.16,47.04 15,46.89 15,45.66 14.49,45.15 13.62,45.15 13.34,44.87 8.62,44.87 D5.2 ; 18.26,47.04 18.25,47.04 R54.2 ; 18.26,47.04 v1(19.04,47.04) 19.66,47.66 U5.3
  Bottom Layer w0.152: v1(23.2,47.05) 22.96,46.81 19.27,46.81 v1(19.04,47.04) ; v1(36.97,30.43) v1(36.97,31.8)
IN34: length 9.3
  Top Layer w0.152: U5.6 20.27,43.85 18.73,45.39 17.14,45.39 16.9,45.63 15.37,45.63 14.61,44.87 13.73,44.87 12.92,44.06 CN10.3
IO13: length 68.3
  Top Layer w0.152: U5.16 25.37,33.32 25.52,33.48 34.23,33.48 35.16,34.41 35.16,37.1 34.39,37.87 27.56,37.87 22.75,42.68 22.75,44.35 22.6,44.5 22.6,50.19 23.57,51.16 40.24,51.16 40.86,51.78 40.86,55.03 R53.1
  Bottom Layer w0.152: CN10.4 14.9,44.77 16.08,44.77 16.78,44.07 22.37,44.07 v1(22.7,44.4)
IO15: length 19.9
  Top Layer w0.152: U5.23 34.26,31.62 34.93,30.94 40.46,30.94 41.38,30.02 43.68,30.02 45.84,27.86 49.25,27.86 49.76,27.36 49.76,26.43 50.25,25.94 CN8.5
IP_VIN: length 6.6
  Top Layer w0.152: R7.1 R8.2 9.64,35.22 U1.12 9.64,34.36 9.22,34.36 9.22,33.94 U1.13
M0_EN: length 67.2
  Top Layer w0.152: U13.2 2.32,21.17 1.56,21.17 ; 1.56,21.57 2.33,21.57 ; 1.56,21.57 1.56,21.17 ; 1.56,21.57 1.56,21.94 2.82,23.2 5.21,23.2 6.17,22.24 6.6,22.24 R38.1 ; 1.56,21.17 1.56,20.88 1.67,20.78 2.32,20.78 U13.3 ; v1(37.18,47.65) 38.8,47.65 U5.36
  Bottom Layer w0.152: v1(2.32,22.65) 2.24,22.72 2.24,35.93 3.05,36.74 9.42,36.74 11.9,39.22 26.1,39.22 28.79,41.91 28.79,46.43 30.01,47.65 v1(37.18,47.65)
M0_IN1: length 44.6
  Top Layer w0.152: U5.8 20.95,41.45 22.9,41.45 23.97,40.38 v1(23.97,40.03) ; v1(1.49,22.64) 1.44,22.64 1.21,22.4 1.21,20.67 1.52,20.37 U13.4
  Bottom Layer w0.152: v1(1.49,22.64) 1.96,23.11 1.96,36.05 2.94,37.02 9.31,37.02 11.78,39.49 22.67,39.49 23.04,39.86 23.8,39.86 v1(23.97,40.03)
M0_IN2: length 41.8
  Top Layer w0.152: U13.5 1.31,19.97 0.93,20.34 0.93,23.14 1.19,23.4 v1(1.35,23.4) ; U5.9 22.43,40.04 v1(22.44,40.03)
  Bottom Layer w0.152: v1(22.44,40.03) 22.19,39.77 11.66,39.77 9.19,37.3 2.82,37.3 1.68,36.16 1.68,23.73 v1(1.35,23.4)
M0_IN3: length 45.7
  Top Layer w0.152: U5.10 21.13,38.77 21.53,39.16 22.85,39.16 23.21,39.52 v1(23.21,40.39) ; 0.89,24.01 0.65,23.77 0.65,20.02 1.1,19.57 U13.6
  Bottom Layer w0.152: v1(0.88,24.02) 1.4,24.54 1.4,36.28 2.71,37.58 8.97,37.58 11.47,40.08 21.68,40.08 22.19,40.59 23.01,40.59 v1(23.21,40.39)
M0_OUT1: length 14.4
  Top Layer w0.203: 3.27,17.77 3.33,17.82 3.38,18.11 U13.9
  Top Layer w0.381: 3.27,17.77 3.27,15.1 4.07,14.3 11.55,14.3 H13.3
M0_OUT2: length 10.5
  Top Layer w0.381: H13.2 10.76,15.8 9.77,14.81 4.28,14.81 3.78,15.31 3.78,17.91
M0_OUT3: length 7.1
  Top Layer w0.203: 4.28,17.77 4.23,17.82 4.18,18.11 U13.11
  Top Layer w0.381: 4.28,17.77 4.28,15.72 4.66,15.34 7.51,15.34 H13.1
M1_EN: length 44.9
  Top Layer w0.152: 52.92,36.08 52.92,35.71 52.98,35.65 53.73,35.65 U14.3 ; 52.92,36.08 52.92,36.48 ; 52.92,36.08 53.76,36.08 U14.2 ; 52.92,36.48 52.92,36.5 49.13,36.5 48.1,37.53 47.41,37.53 v1(47.31,37.43) ; 52.92,36.48 U14.1 54.08,36.48 54.08,37.78 54.41,38.11 55.47,38.11 55.96,38.6 55.96,39.51 56.38,39.93 R39.1 ; v1(30.79,35.15) 30.56,35.38 23.23,35.38 21.54,33.69 U5.14
  Bottom Layer w0.152: v1(47.31,37.43) 47.31,37.1 47.18,36.98 46.85,36.98 46.27,36.4 33.93,36.4 33.24,37.08 31.2,37.08 30.79,36.67 v1(30.79,35.15)
M1_IN1: length 35
  Top Layer w0.152: U14.4 52.96,35.28 52.02,36.22 49.01,36.22 48.25,36.98 v1(47.93,36.98) ; v1(31.39,36.55) 31.06,36.22 22.95,36.22 21.67,37.5 U5.11
  Bottom Layer w0.152: v1(47.93,36.98) 47.65,36.7 46.97,36.7 46.38,36.12 33.81,36.12 33.2,36.73 31.56,36.73 v1(31.39,36.55)
M1_IN2: length 34.4
  Top Layer w0.152: v1(32.13,36.19) 32.13,36.18 31.89,35.94 21.1,35.94 U5.12 ; v1(48.27,36.24) 48.57,35.94 51.91,35.94 52.97,34.88 U14.5
  Bottom Layer w0.152: v1(48.27,36.24) 48.08,36.42 47.08,36.42 46.5,35.84 33.7,35.84 33.11,36.42 32.36,36.42 v1(32.13,36.19)
M1_IN3: length 34.3
  Top Layer w0.152: v1(47.49,35.91) 47.74,35.66 51.79,35.66 52.97,34.48 U14.6 ; U5.13 21.85,34.96 22.55,35.66 32.68,35.66 32.87,35.85 32.87,35.91
  Bottom Layer w0.152: v1(47.49,35.91) 47.13,35.56 33.23,35.56 32.87,35.91
  vias: v1(32.89,35.91)
M1_OUT1: length 20.7
  Top Layer w0.203: U14.9 54.81,32.97 54.75,32.92 54.75,32.73 54.7,32.68
  Top Layer w0.381: H14.3 51.4,15.32 52.39,15.32 54.7,17.63 54.7,32.68
M1_OUT2: length 23.4
  Top Layer w0.381: H14.2 50.1,14.81 52.6,14.81 55.21,17.42 55.21,32.82
M1_OUT3: length 27.5
  Top Layer w0.203: 55.72,32.68 55.67,32.73 55.67,32.92 55.61,32.97 U14.11
  Top Layer w0.381: H14.1 48.07,14.3 52.81,14.3 55.72,17.2 55.72,32.68
OLED_CS: length 58
  Top Layer w0.152: v1(37.74,31.8) 37.25,32.28 37.25,32.86 35.73,34.38 35.73,37.32 34.62,38.43 27.79,38.43 23.48,42.73 23.48,44.32 23.72,44.55 24.61,44.55 24.76,44.4 25.52,44.4 26.44,45.32 36.61,45.32 38.08,43.85 U5.33 ; v1(37.74,30.15) 37.97,30.38 40.23,30.38 41.15,29.46 43.45,29.46 45.61,27.3 49.02,27.3 49.2,27.13 49.2,26.14 49.48,25.86 49.48,25.05 49.76,24.77 49.76,23.89 50.21,23.44 CN8.3
  Bottom Layer w0.152: v1(37.74,31.8) 37.74,31.79 v1(37.74,30.15)
OLED_SCLK: length 25.7
  Top Layer w0.152: U5.24 35.53,31.29 40.5,31.29 ; 40.5,31.29 40.5,32.82 40.11,33.21 40.11,34.02 40.66,34.57 40.66,37.21 40.97,37.52 40.97,38.04 41.34,38.4 R26.1 ; 40.5,31.29 41.5,30.3 43.79,30.3 45.95,28.14 49.37,28.14 50.32,27.19 CN8.6
OLED_SDI: length 18.6
  Top Layer w0.152: v1(40.62,33.67) 40.62,33.1 40.78,32.94 40.78,31.41 41.61,30.58 43.91,30.58 46.05,28.44 CN8.7 ; v1(37.43,35.05) 38.72,35.05 U5.26
  Bottom Layer w0.152: v1(37.43,35.05) 39.24,35.05 v1(40.62,33.67)
RTS: length 6.1
  Top Layer w0.152: 5.58,44.17 5.43,44.17 5.28,44.02 5.28,43.21 4.53,42.46 2.55,42.46 2.01,43 U15.4
RXD0: length 34.2
  Top Layer w0.152: U5.34 38.18,45.12 37.69,45.62 26.1,45.62 25.86,45.37 v1(25.77,45.37) ; R59.2 9.45,42.81 15.32,42.81 v1(15.49,42.97)
  Bottom Layer w0.152: v1(25.77,45.37) 25.64,45.51 24.9,45.51 24.58,45.19 24.58,43.89 24.15,43.46 15.97,43.46 v1(15.49,42.97)
SCL_0: length 61.4
  Top Layer w0.152: v1(3.5,10.62) 3.5,11.12 3.25,11.37 CN11.2 ; 36.72,40.49 37.74,40.49 38.18,40.04 U5.30 39.57,40.04 40.06,40.53 40.06,41.4 40.44,41.77 40.44,42.43 40.98,42.97 R41.1
  Bottom Layer w0.152: 36.72,40.49 36.72,40.13 36.26,39.67 30.22,39.67 27.07,36.52 17.49,36.52 10.1,29.13 10.1,20.76 3.83,14.48 3.83,10.94 v1(3.5,10.62)
  vias: v1(36.69,40.49)
SCL_1: length 85.5
  Top Layer w0.152: R40.1 40.68,41.45 40.34,41.12 40.34,40.3 40.06,40.02 40.06,39.26 39.57,38.77 U5.29 37.34,38.77 36.92,38.35 v1(36.92,36.98) ; v1(25.06,9.42) 25.22,9.42 25.47,9.68 46.92,9.68 48.41,11.17 55.36,11.17 55.52,11.32 55.52,11.97 CN12.2 ; H15.3 26.2,16.15 27.22,17.17 27.22,22.2 22.5,26.92 22.5,33.48 23.05,34.03 34,34.03 34.6,34.64 34.6,36.51 34.19,36.92 v1(34.12,36.92)
  Bottom Layer w0.152: v1(34.12,36.92) 34.37,36.68 36.92,36.68 v1(36.92,36.98) ; v1(25.06,9.42) 25.06,9.57 24.93,9.7 24.93,14.87 26.1,16.04 H15.3
SDA_0: length 63.1
  Top Layer w0.152: R42.1 40.88,44.5 40.16,43.78 40.16,41.95 39.52,41.31 U5.31 38.55,41.04 37.41,41.04 v1(37.23,41.22) ; CN11.3 4.26,12 4.26,10.25 v1(4.04,10.03)
  Bottom Layer w0.152: v1(4.04,10.03) 4.11,10.1 4.11,14.37 10.38,20.64 10.38,29.02 17.61,36.24 27.18,36.24 30.28,39.34 36.47,39.34 37.23,40.1 v1(37.23,41.22)
SDA_1: length 112
  Top Layer w0.152: v1(36.41,48.16) 37.19,48.93 U5.37 41.11,48.93 41.5,48.54 R43.1 ; 25.8,9.17 26.03,9.4 47.03,9.4 48.53,10.89 56.15,10.89 56.47,11.22 CN12.3 ; H15.4 28.49,16.15 27.5,17.14 27.5,22.31 22.78,27.04 22.78,33.36 23.17,33.75 34.12,33.75 34.88,34.52 34.88,36.89 34.18,37.59 27.44,37.59 25.31,39.72 v1(24.98,39.72)
  Bottom Layer w0.152: H15.4 27.73,16.15 26.65,15.07 25.53,15.07 25.21,14.76 25.21,10.08 25.8,9.5 25.8,9.17 ; v1(24.98,39.72) 26.22,39.72 28.52,42.02 28.52,46.55 29.9,47.93 36.19,47.93 v1(36.41,48.16)
  vias: v1(25.82,9.17)
SERVO_RX: length 33.6
  Top Layer w0.152: R49.1 57.99,46.55 55.83,46.55 55.05,45.76 47.9,45.76 47.54,46.12 47.54,47.17 47.3,47.41 44.3,47.41 43.57,46.67 41.05,46.67 40.81,46.43 40.81,45.63 41.04,45.4 42.07,45.4 42.4,45.07 42.4,40.88 42.1,40.59 41.02,40.59 40.9,40.47 40.9,40.05 40.62,39.77 40.62,39.03 40.39,38.79 40.39,37.72 40.1,37.44 40.1,36.67 39.66,36.23 U5.27
SERVO_TX: length 27.5
  Top Layer w0.152: 45.31,47.69 43.17,47.69 R47.1 42.44,46.95 40.85,46.95 40.53,46.63 40.53,45.52 40.94,45.11 41.94,45.11 42.12,44.93 42.12,41.02 41.97,40.87 40.91,40.87 40.62,40.58 40.62,40.16 40.34,39.88 40.34,39.15 40.11,38.91 40.11,37.84 39.77,37.5 U5.28 ; 45.31,47.69 45.29,47.7 45.29,49.11 45.55,49.37 46.57,49.37 47.33,50.13 48.32,50.13 R48.1 ; 45.31,47.69 47.63,47.69 47.88,47.44 49.53,47.44 U10.2
TXD0: length 35.6
  Top Layer w0.152: U5.35 38.15,46.39 37.66,45.9 25.58,45.9 25.22,45.53 25.22,45.11 v1(25.09,44.98) ; R58.2 8.26,40.23 8.26,41.23 9.56,42.53 14.91,42.53 15.07,42.38 15.81,42.38 v1(16.35,42.92)
  Bottom Layer w0.152: v1(25.09,44.98) 24.86,44.75 24.86,43.77 24.26,43.18 16.6,43.18 v1(16.35,42.92)
TXEN: length 8.5
  Top Layer w0.152: 45.94,48.42 48.06,48.42 R50.2 49.4,48.25 U10.1 50.02,48.45 50.68,47.79 52.71,47.79 53.36,48.45 U3.1
VISION_ADC: length 5.8
  Top Layer w0.152: R57.2 R56.1 16.91,46.28 17.52,45.67 18.69,45.67 19.41,46.39 U5.4
VSTA: length 19.1
  Top Layer w0.152: v1(19.4,45.52) 19.79,45.12 U5.5 ; 16.85,36.5 16.98,36.62 R13.1 17.61,39.93 18.48,39.93 19.07,40.51 19.07,41.54 18.65,41.96 17.82,41.96 17.52,42.26 17.52,43.23 17.77,43.48 18.84,43.48 19.14,43.79 19.14,44.58 18.61,45.11 v1(16.68,45.11)
  Bottom Layer w0.152: v1(16.68,45.11) 17.09,45.52 v1(19.4,45.52)
$1N6461: length 1.4
  Top Layer w0.152: 46.57,43.49 46.53,43.45 45.18,43.45
$1N6486: length 2.2
  Top Layer w0.152: R47.2 43.21,46.22 44.95,46.22 44.99,46.25 44.99,46.42
$1N6507: length 1.4
  Top Layer w0.152: R53.2 44.09,55.42 LED2.2
$1N16875: length 2.3
  Top Layer w0.152: U13.14 5.67,19.57 5.83,19.4 5.83,19.16 6.35,18.64 6.57,18.64 C43.1
$1N17094: length 4.5
  Top Layer w0.152: U13.18 5.69,21.17 6.85,20.01 C41.1 6.97,19.71 8.39,21.13
$1N17219: length 5.2
  Top Layer w0.152: R30.2 5.09,22.92 3.09,22.92 2.98,22.81 U13.24
$1N17548: length 1.5
  Top Layer w0.152: C44.1 57.99,34.48 U14.14
$1N17578: length 3.4
  Top Layer w0.152: R31.1 58.17,38.48 C42.1 58.17,36.99 57.26,36.08 U14.18
$1N17586: length 3
  Top Layer w0.152: R31.2 55.92,37.83 54.59,37.83 54.41,37.65 U14.24
$1N17803: length 4.4
  Top Layer w0.152: R58.1 6.07,39.57 4.86,40.78 3.28,40.78 3.01,40.51 U15.9
$1N17807: length 4.6
  Top Layer w0.152: R59.1 5.95,41.06 2.93,41.06 2.51,40.64 U15.8
$1N18226: length 6.6
  Top Layer w0.152: C30.1 41.5,32.24 42.04,31.7 45.56,31.7 46.02,32.15 46.02,33.63
$1N18314: length 2.2
  Top Layer w0.152: C30.2 44.91,32.43 U16.6
$1N18404: length 2.2
  Top Layer w0.152: U16.5 45.09,33.57 43.82,33.57 43.56,33.83 R32.2
$1N18959: length 3.9
  Top Layer w0.152: R33.2 R34.1 43.46,35.36 44.28,34.53 U16.4
$1N52202: length 5.9
  Top Layer w0.152: R60.2 40.81,18.96 C50.2 41.47,20.88 42.56,20.88 44.39,19.05 U8.5
$1N52203: length 2.6
  Top Layer w0.152: U8.4 43.36,18.94 R61.2 C51.2
$1N55084: length 6
  Top Layer w0.152: U8.1 45.34,20.91 v1(45.31,20.88) ; v1(46.32,17.47) 46.22,17.47 46.22,18.25 Q4.4
  Bottom Layer w0.152: v1(46.32,17.47) 46.17,17.47 45.31,18.34 v1(45.31,20.88)
$1N55091: length 3.7
  Top Layer w0.152: U8.2 44.39,20.62 45.46,19.55 Q4.2
$1N62719: length 3.1
  Top Layer w0.152: USB1.A5 7.75,48.3 7.45,48 6.43,48 6.1,47.67 6.1,47.28
$1N62774: length 4
  Top Layer w0.152: USB1.B5 4.83,48.98 4.83,47.03 4.63,46.83 R64.1
$1N62802: length 15.1
  Top Layer w0.152: R64.2 1.44,49.73 USB1.EP ; R63.2 6.85,46.52 7.88,46.52 C8.1
  Bottom Layer w0.152: USB1.EP USB1.EP ; USB1.EP USB1.EP
$1N62804: length 8.3
  Top Layer w0.152: R15.2 9.78,45.77 10.14,45.4 12.55,45.4 12.7,45.55 12.7,47.38 12.23,47.85 11.96,47.85
$3N556: length 4.4
  Top Layer w0.152: U1.4 13.62,32.94 14.1,33.41 14.1,34.25 14.69,34.84 15.99,34.84
$3N752: length 35.4
  Top Layer w0.152: 18.38,55.42 19.09,54.71 19.09,51.56 19.5,51.15 21.68,51.15 22.14,50.7 22.14,42.89 24.48,40.55 24.48,37.13 v1(24.58,37.03) ; U1.6 13.5,33.94 v1(13.59,33.85)
  Bottom Layer w0.152: v1(24.58,37.03) 24.35,36.8 17.34,36.8 14.33,33.8 13.64,33.8 v1(13.59,33.85)
$3N756: length 1.4
  Top Layer w0.152: LED3.2 16.85,55.46 16.89,55.42
$3N853: length 3.2
  Top Layer w0.152: U1.7 12.14,35.21 12.69,35.76 13.71,35.76 13.94,35.99 R3.2
$3N895: length 2.2
  Top Layer w0.152: U1.8 11.64,35.11 12.54,36.02 R4.2
$3N1011: length 1.9
  Top Layer w0.152: R5.2 11.14,36.5 U1.9
$3N1091: length 2
  Top Layer w0.152: U1.11 10.14,36.11 R6.2
$3N1196: length 5.9
  Top Layer w0.305: C1.2 7.22,31.94 U1.17 ; C1.2 7.2,32.1 8.04,32.94 U1.15 ; C1.2 7.69,32.44 U1.16
$3N1270: length 1.8
  Top Layer w0.152: C1.1 7.24,33.44 U1.14
$3N1671: length 4.4
  Top Layer w0.305: C4.1 10.57,28.82 10.14,29.25 ; 10.14,29.25 9.64,29.75 U1.19 ; 10.14,29.25 U1.20
$3N1854: length 14
  Top Layer w0.305: U1.21 10.64,29.76 11.14,29.26 ; U1.22 11.14,29.26 ; 11.14,29.26 C5.2
  Top Layer w0.762: D6.1 15.06,29.95 L2.1 15.06,24.73 14.3,23.97 12.73,23.97 12.01,24.69 C6.2
$3N2358: length 17.2
  Top Layer w0.152: U1.23 11.64,29.96 12.68,28.92 12.68,24.91 13.03,24.55 14,24.55 14.31,24.86 14.31,28.72 14,29.02 14,32.4 14.47,32.87 R9.1
$3N3338: length 3.1
  Top Layer w0.152: R14.1 10.93,40.93 11.44,41.44 12.84,41.44 Q5.5
$3N4665: length 2.4
  Top Layer w0.152: R13.2 15.1,39.66 13.49,39.66 Q5.3

## Copper pours and planes (outline as drawn; the poured copper is in the pictures)
GND on Top Layer: 45.8,20.82 46.97,20.82 46.97,19.95 45.8,19.95
GND on Top Layer: -0.82,57.3 60.95,57.3 60.95,-0.41 -0.82,-0.41
GND on Bottom Layer: -0.57,57.86 60.95,57.86 60.95,-0.66 -0.57,-0.66
VBUS on Top Layer: 4,40.05 5.12,40.05 5.12,38.99 4,38.99
VBUS on Top Layer: 3.5,48.26 4.61,48.26 4.61,47.19 3.5,47.19
VBUS on Bottom Layer: 3.5,48.26 4.61,48.26 4.61,47.19 3.5,47.19
VBUS on Bottom Layer: 4,40.05 5.12,40.05 5.12,38.99 4,38.99
VCC-5V on Top Layer: 50.54,45.46 56.48,45.46 56.48,38.45 50.54,38.45
VIN on Top Layer: 47.34,35.46 52.82,35.46 52.82,33.48 47.34,33.48
VIN on Top Layer: 56.33,33.83 58.51,33.83 58.51,29.93 56.33,29.93
VIN on Top Layer: 4.82,19.4 17.82,19.4 17.82,16.15 4.82,16.15
VIN on Top Layer: 56.48,33.4 57.59,33.4 57.59,32.33 56.48,32.33
VIN on Top Layer: 43.57,14.45 44.69,14.45 44.69,13.38 43.57,13.38
VIN on Top Layer: 43.58,15.85 44.74,15.85 44.74,13.41 43.58,13.41
VIN on Bottom Layer: 43.57,14.45 44.69,14.45 44.69,13.38 43.57,13.38
VIN on Bottom Layer: 56.48,33.4 57.59,33.4 57.59,32.33 56.48,32.33
B- on Top Layer: 42.26,16.66 42.76,17.17 42.76,18.34 43.02,18.59 44.44,18.59 44.61,18.76 44.61,19.21 44.7,19.3 46.88,19.3 46.93,19.25 46.93,18.64 46.78,18.49 46.12,18.49 46.02,18.39 46.02,16.76 45.86,16.61 44.14,16.61 43.02,15.49 42.26,16.25
$1N18226 on Top Layer: 44.47,39.53 48.2,39.53 48.2,33.27 44.47,33.27
$1N52206 on Top Layer: 47.69,19.96 48.81,19.96 48.81,18.49 47.69,18.49
$1N62802 on Top Layer: 3.6,48.4 1.05,48.4 0.77,48.68 0.77,51.09 1.4,51.73 10.67,51.73 11.62,50.78 11.62,48.74 11.18,48.3 11.18,48.17 12.45,46.9 12.45,45.51 12.3,45.36 11.67,45.36 10.71,46.32 8.67,46.32 8.39,46.6 8.39,47.67 9.28,48.55 9.28,49.82 8.51,50.59 4.56,50.59 3.6,49.63
$3N1196 on Top Layer: 3.27,32.94 8.17,32.94 8.17,29.53 3.27,29.53
$3N1671 on Top Layer: 9.5,30.04 11.21,30.04 11.21,24.63 9.5,24.63
$3N1854 on Top Layer: 10.52,30.04 12.45,30.04 12.45,24.63 10.52,24.63

Small or netless copper shapes (teardrops, artwork), in the pictures only: 4 on Top Layer, 6 on Bottom Layer

## Text on the board
Bottom Silkscreen Layer: GND | VIN | DATA | BLDC | ONLY | ESP32 WROOM 32 | M2 | 5V | I34 | IO13 | IO0 | 1.6mm | www.navbot.com
Top Solder Mask Layer: 09/02/26
Top Silkscreen Layer: VCC | GND | SCL | SDA | SCLK | SDIN | RES | DC | CS | 5V | RST | PWR | MPU-6050 | NAVBOT-EN01 | VERSION:V1.5
